# Altium schematic sheet Power_Section.SchDoc (part 3 of 3)
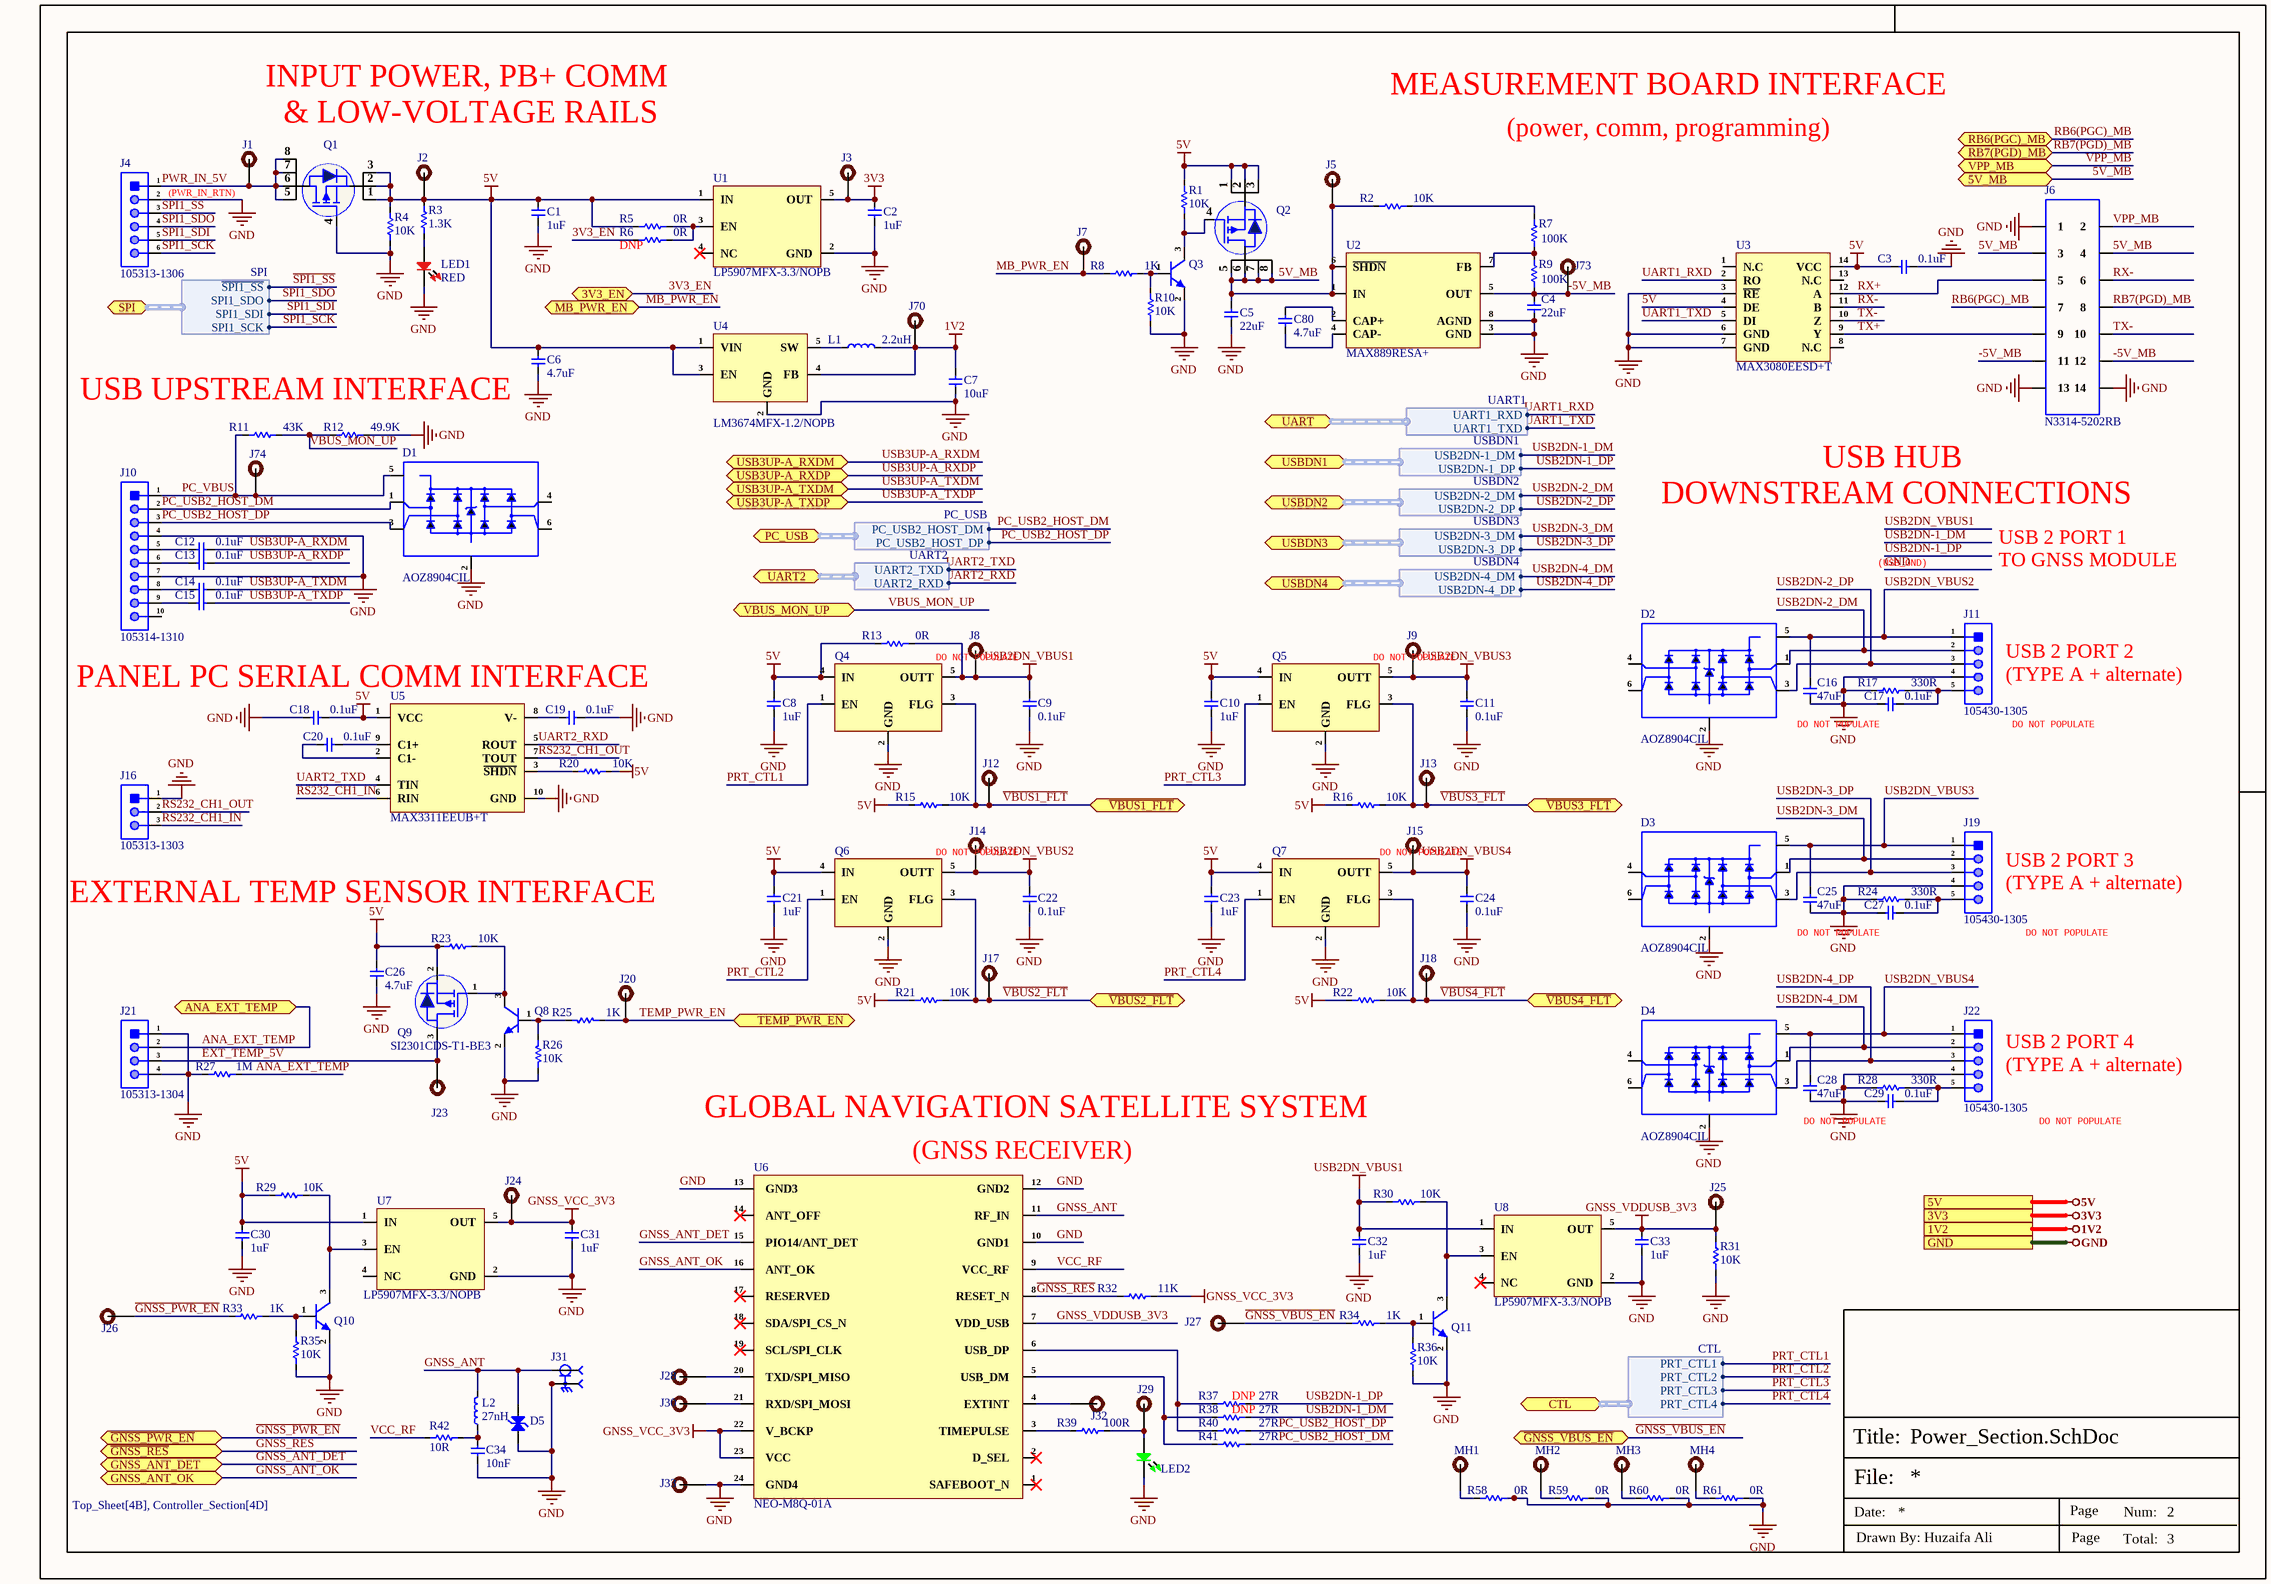
[diagram p2: Power_Section.SchDoc]

## Library data of the parts (continued)
U3 = MAX3080EESD+T: MAX3080 Series 115 kbps 5.25 V Full Duplex RS-485/RS-422 Transceiver - SOIC-14; Manufacturer: Maxim; Number of Receivers: 1; Operating Supply Voltage: 5V; Max Power Dissipation: 800mW; Output Current: 1uA; Output Voltage: 13V; Supply Current: 375uA; Item Type: IC; Supplier: Digikey; Supplier Part Number: MAX3080EESD+TCT-ND; Manufacturer Part Number: MAX3080EESD+T; RoHS: Yes; Category: RS-232 / RS-422 / RS-485 Interface ICs; Stock: 1816; Pricing: 1=6.26, 10=5.625, 25=5.3176, 100=4.6086, 250=4.37228, 500=3.92324, 1000=3.30876 (USD); Mounting Technology: Surface Mount; Case/Package: SOIC; Min Operating Temperature: -40°C; Max Operating Temperature: 85°C; Packaging: Tape and Reel; Number of Transmitters: 1; Logic Function: Transceiver; Package Quantity: 2500; Number of Drivers: 1; Data Rate: 115Kbps; Series: MAX3080E; RoHS Compliant: Yes; Lead Free: Lead Free; ComponentLink1URL: https://datasheet.ciiva.com/12260/max3080e-max3089e-99170-12260438.pdf?src-supplier=Mouser; ComponentLink1Description: https://datasheet.ciiva.com/12260/max3080e-max3089e-99170-12260438.pdf?src-supplier=Mouser; ComponentLink2URL: https://datasheet.ciiva.com/14430/max3080e-max3089e-14430038.pdf?src-supplier=Avnet; ComponentLink2Description: https://datasheet.ciiva.com/14430/max3080e-max3089e-14430038.pdf?src-supplier=Avnet; ComponentLink3URL: https://datasheet.ciiva.com/1774/max3080e-max3089e-1774749.pdf?src-supplier=Digikey; ComponentLink3Description: https://datasheet.ciiva.com/1774/max3080e-max3089e-1774749.pdf?src-supplier=Digikey; Package: 14-SOIC
U4 = LM3674MFX-1.2/NOPB: IC REG BUCK 1.2V 600MA SOT23-5; Manufacturer: TI National Semiconductor; Number of Outputs: 1; Min Input Voltage: 2.7V; Max Supply Voltage: 5.5V; Switching Frequency: 2MHz; Synchronous Rectifier: Yes; Quiescent Current: 300uA; Output Type: Fixed; Output Configuration: Positive; Supplier: Mouser; LCSC Part Number: C2071166; Manufacturer Part Number: LM3674MFX-1.2/NOPB; RoHS: Yes; Item Type: IC; Stock: 390; Pricing: 1=1.54, 10=1.38, 50=1.38, 100=1.07, 1000=0.702, 10000=0.599 (USD); Mounting Technology: Surface Mount; Case/Package: SOT-23-5; Pins: 5; Min Operating Temperature: -30°C; Max Operating Temperature: 85°C; Packaging: Tape and Reel; Output Voltage: 1.2V; Max Output current: 600mA; Output Current: 600mA; Package Quantity: 3000; Min Output Voltage: 1.2V; Operating Supply Voltage: 5.5V; Series: -; Radiation Hardening: No; Lead Free: Lead Free; RoHS Compliant: Yes; ComponentLink1URL: http://components.arrow.com/part/dataview/56701705S8560073N1317?src-supplier=Arrow+Electronics; ComponentLink1Description: http://components.arrow.com/part/dataview/56701705S8560073N1317?src-supplier=Arrow+Electronics; ComponentLink2URL: http://www.ti.com/general/docs/suppproductinfo.tsp?distId=10&amp;gotoUrl=http%3A%2F%2Fwww.ti.com%2Flit%2Fgpn%2Flm3674&src-supplier=Digikey; ComponentLink2Description: http://www.ti.com/general/docs/suppproductinfo.tsp?distId=10&amp;gotoUrl=http%3A%2F%2Fwww.ti.com%2Flit%2Fgpn%2Flm3674&src-supplier=Digikey; ComponentLink3URL: http://www.ti.com/lit/gpn/lm3674?src-supplier=Mouser; ComponentLink3Description: http://www.ti.com/lit/gpn/lm3674?src-supplier=Mouser; ComponentLink4URL: http://www.ti.com/lit/ds/symlink/lm3674.pdf?src-supplier=Avnet; ComponentLink4Description: http://www.ti.com/lit/ds/symlink/lm3674.pdf?src-supplier=Avnet; ComponentLink5URL: http://www.ti.com/lit/ds/symlink/lm3674.pdf?src-supplier=Digikey; ComponentLink5Description: http://www.ti.com/lit/ds/symlink/lm3674.pdf?src-supplier=Digikey
U5 = MAX3311EEUB+T: IC TXRX RS232 460KBPS 10-UMAX; Manufacturer: Maxim; Simplex/Duplex: Full Duplex; Receiver Hysteresis: 500mV; Supplier: Digikey; Supplier Part Number: MAX3311EEUB+TCT-ND; Manufacturer Part Number: MAX3311EEUB+T; RoHS: Yes; Category: RS-232 / RS-422 / RS-485 Interface ICs; Stock: 3791; Pricing: 1=5.92, 10=5.32, 25=5.0292, 100=4.3588, 250=4.13524, 500=3.71054, 1000=3.12937 (USD); Mounting Technology: Surface Mount; Case/Package: UMAX; Min Operating Temperature: -40°C; Max Operating Temperature: 85°C; Packaging: Cut Tape; Data Rate: 460Kbps; Series: -; Lead Free: Lead Free; RoHS Compliant: Yes; ComponentLink1URL: https://datasheet.ciiva.com/14430/max3311e-max3313e-14430143.pdf?src-supplier=Avnet; ComponentLink1Description: https://datasheet.ciiva.com/14430/max3311e-max3313e-14430143.pdf?src-supplier=Avnet; ComponentLink2URL: https://datasheet.ciiva.com/1774/max3311e-max3313e-1774738.pdf?src-supplier=Digikey; ComponentLink2Description: https://datasheet.ciiva.com/1774/max3311e-max3313e-1774738.pdf?src-supplier=Digikey; Item Type: IC; Package: MSOP-10; JLCPCB Part Number: C1121855; ComponentLink3Description: JLCPCB; ComponentLink3URL: https://jlcpcb.com/partdetail/1212276-MAX3311EEUBT/C1121855
U6 = NEO-M8Q-01A: Rf Receiver Gnss/gps 1.575GHZ; Manufacturer: u-blox; Item Type: Module; Interface: I2C,SPI,USB,UART; Sensitivity: -167dBm; ComponentLink1URL: https://www.u-blox.com/sites/default/files/NEO-M8Q-01A_DataSheet_%28UBX-15013820%29.pdf?src-supplier=Digikey; ComponentLink1Description: https://www.u-blox.com/sites/default/files/NEO-M8Q-01A_DataSheet_%28UBX-15013820%29.pdf?src-supplier=Digikey; Supplier: Digikey; Supplier Part Number: 672-1174-1-ND; Manufacturer Part Number: NEO-M8Q-01A; RoHS: Yes; Category: RF Receivers, Transceivers; Stock: 322; Pricing: 1=25, 10=20.244 (USD); Mounting Technology: Surface Mount; Case/Package: SMD/SMT; Min Operating Temperature: -40°C; Max Operating Temperature: 105°C; Frequency: 1.575GHz; Series: NEO-M8Q-01A; RoHS Compliant: Yes